# EasyEDA Pro project ProPrj_STM32H7连接板 _2026-04-26.epro, schematic Schematic1
Board Name: Board1; Create Date: 2025-03-26; Page Name: P1; Project Name: 省赛1; Schematic Name: Schematic1; Update Date: 2025-04-08; Company: 嘉立创EDA; Page Size: A4; Version: V1.0
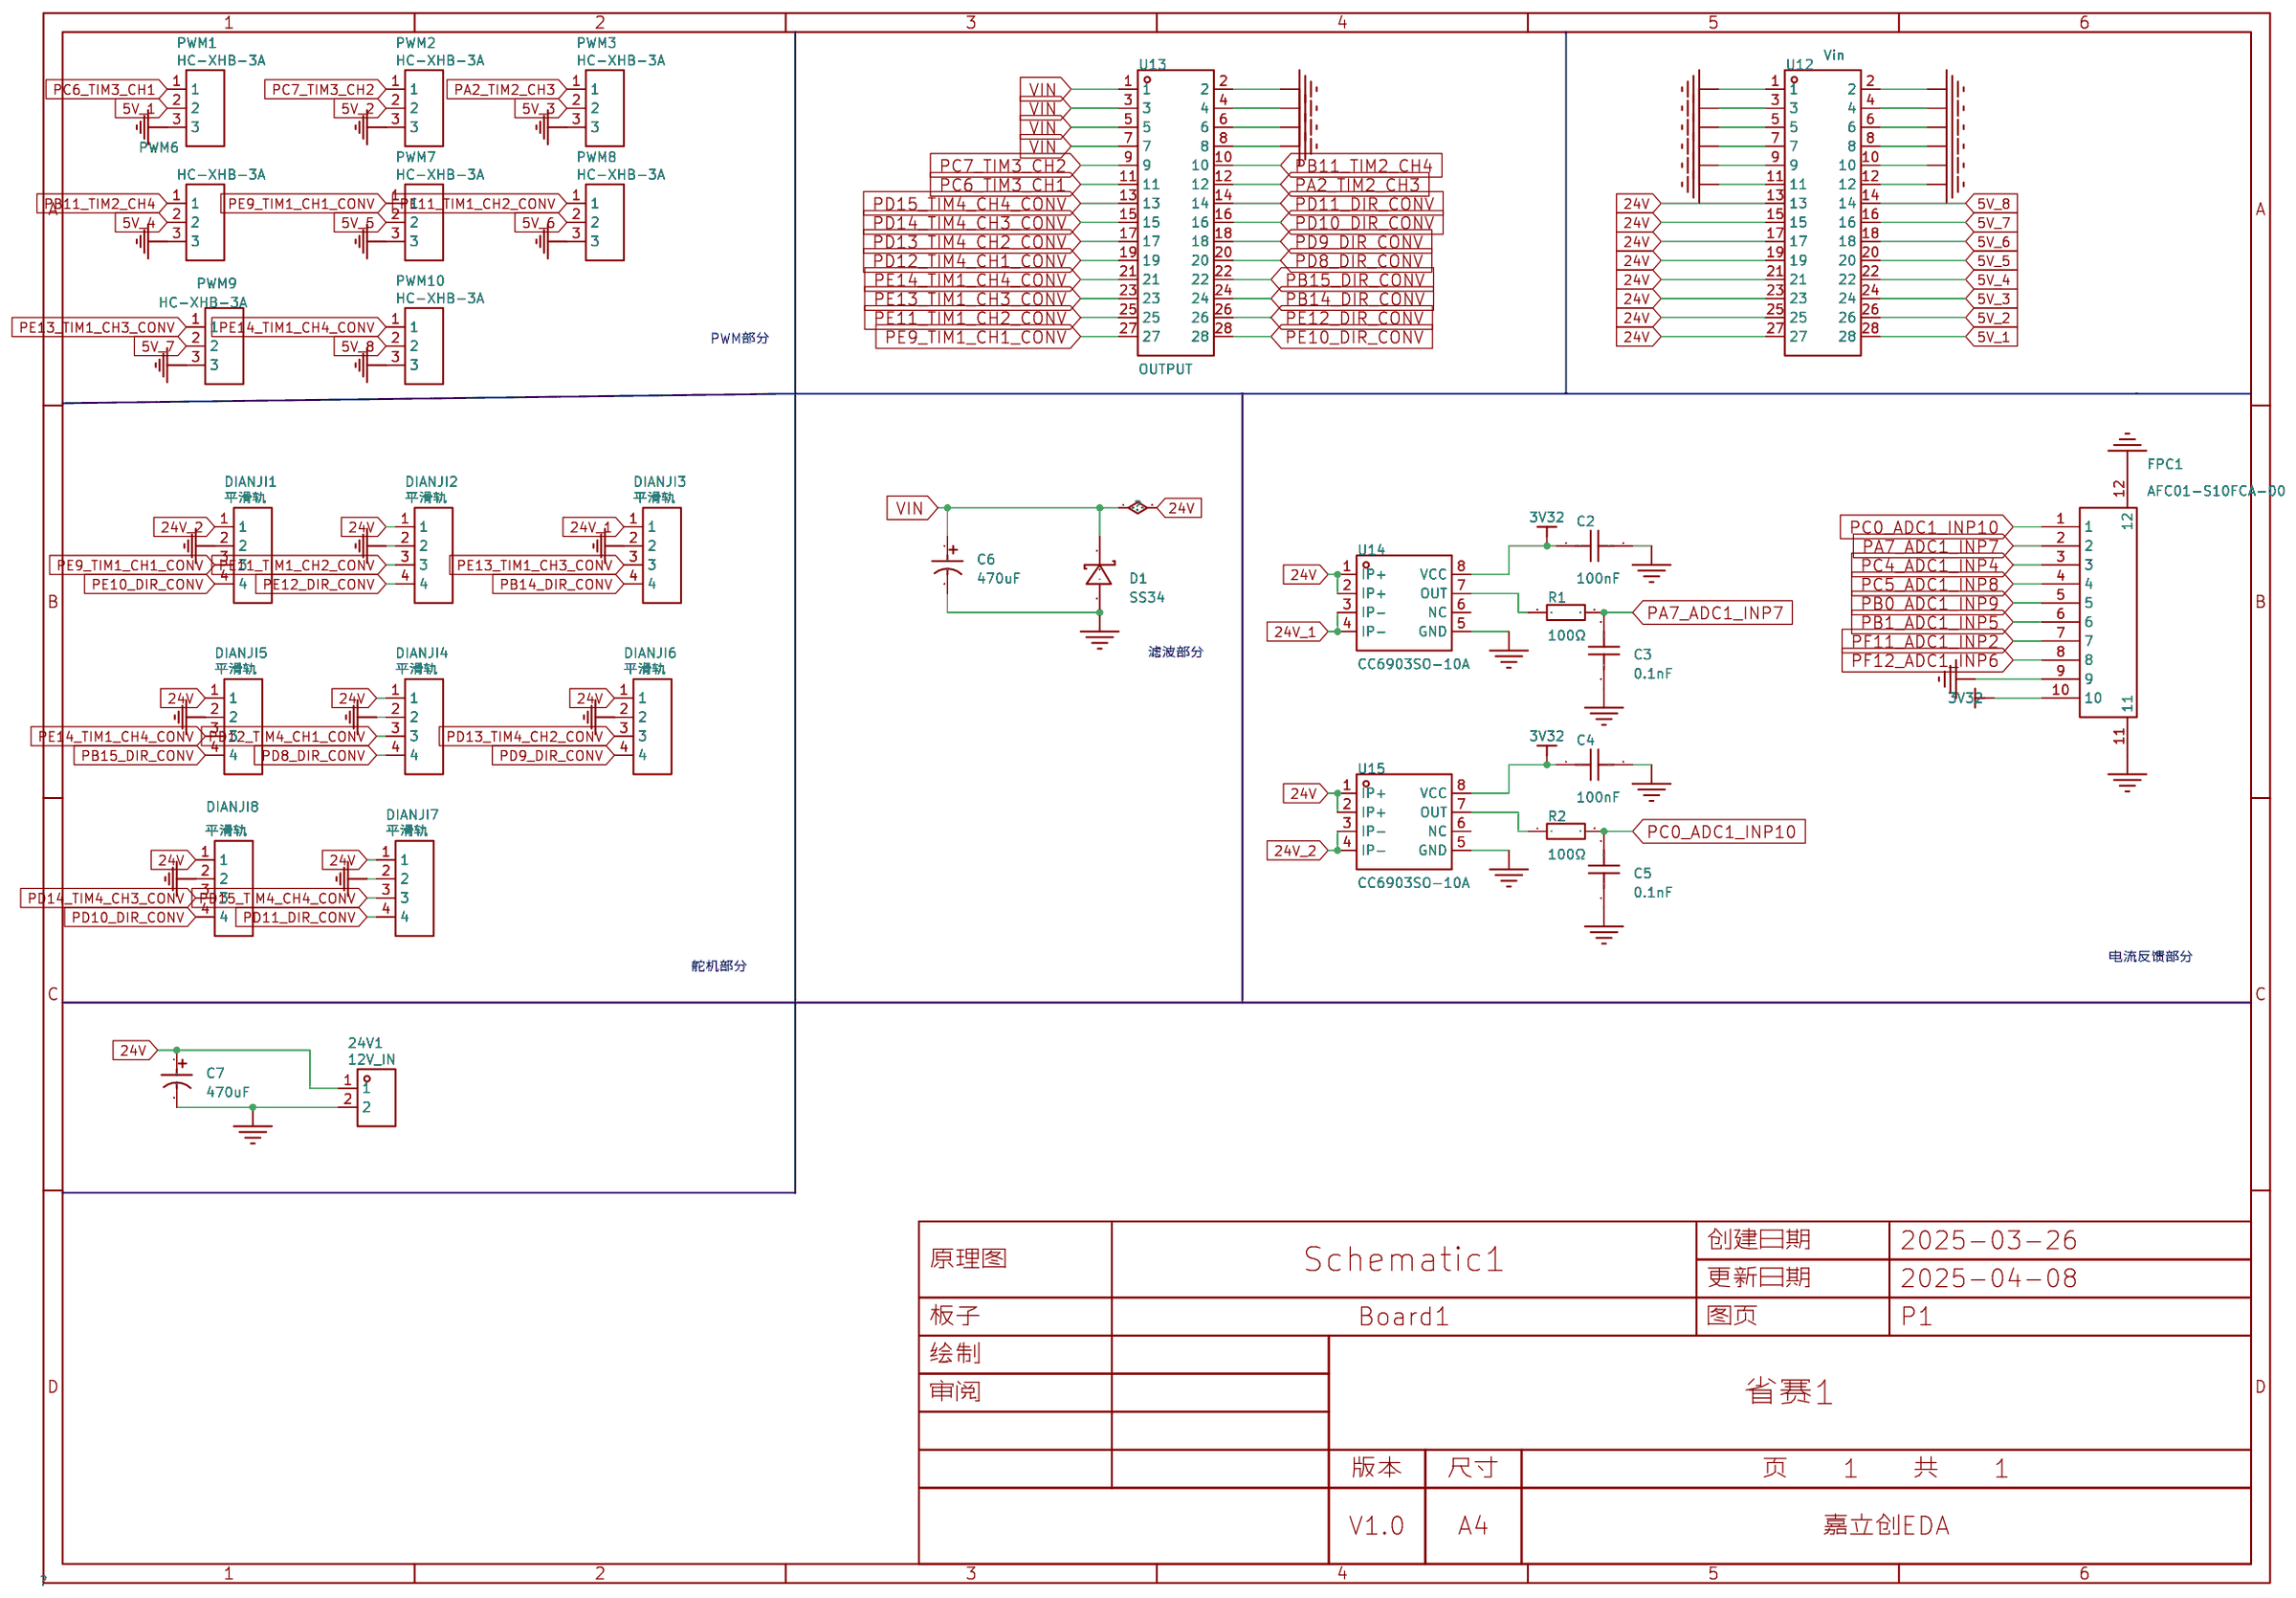
[diagram p0: schematic sheet]

## Parts
24V1  12V_IN  [CONN-TH_XY2500V-A-5.00-2P]
C2  100nF  [C0603]
C3  0.1nF  [C0603]
C4  100nF  [C0603]
C5  0.1nF  [C0603]
C6  470uF  [CAP-TH_BD10.0-P5.00-D1.0-FD]
C7  470uF  [CAP-TH_BD10.0-P5.00-D1.0-FD]
D1  SS34  [SMA_L4.3-W2.6-LS5.2-RD]
DIANJI1  平滑轨  [CONN-TH_XY2500V-A-5.00-4P]
DIANJI2  平滑轨  [CONN-TH_XY2500V-A-5.00-4P]
DIANJI3  平滑轨  [CONN-TH_XY2500V-A-5.00-4P]
DIANJI4  平滑轨  [CONN-TH_XY2500V-A-5.00-4P]
DIANJI5  平滑轨  [CONN-TH_XY2500V-A-5.00-4P]
DIANJI6  平滑轨  [CONN-TH_XY2500V-A-5.00-4P]
DIANJI7  平滑轨  [CONN-TH_XY2500V-A-5.00-4P]
DIANJI8  平滑轨  [CONN-TH_XY2500V-A-5.00-4P]
FPC1  AFC01-S10FCA-00  [FPC-SMD_P0.5-10P_FGS-XJ-H2.0]
PWM1  HC-XHB-3A  [CONN-TH_3P-P2.50_HC-XHB-3A]
PWM2  HC-XHB-3A  [CONN-TH_3P-P2.50_HC-XHB-3A]
PWM3  HC-XHB-3A  [CONN-TH_3P-P2.50_HC-XHB-3A]
PWM6  HC-XHB-3A  [CONN-TH_3P-P2.50_HC-XHB-3A]
PWM7  HC-XHB-3A  [CONN-TH_3P-P2.50_HC-XHB-3A]
PWM8  HC-XHB-3A  [CONN-TH_3P-P2.50_HC-XHB-3A]
PWM9  HC-XHB-3A  [CONN-TH_3P-P2.50_HC-XHB-3A]
PWM10  HC-XHB-3A  [CONN-TH_3P-P2.50_HC-XHB-3A]
R1  100Ω  [Res_1/8W]
R2  100Ω  [Res_1/8W]
U12  Vin  [HDR-TH_28P-P2.54-H-F-R2-C14-W8.5]
U13  OUTPUT  [HDR-TH_28P-P2.54-H-F-R2-C14-W8.5]
U14  CC6903SO-10A  [SOP-8_L4.9-W3.9-P1.27-LS6.0-BL]
U15  CC6903SO-10A  [SOP-8_L4.9-W3.9-P1.27-LS6.0-BL]

## Library data of the parts
24V1 = 12V_IN: Supplier: LCSC; Supplier Part: C505761; Manufacturer: XINLAIYA(新莱亚); Manufacturer Part: XY2500V-A-5.00-2P; JLCPCB Part Class: Extended Part
C2-C5 = CGA0603X7R104K500JT: LCSC Part Name: 100nF ±10% 50V; Supplier Part: C6119867; Manufacturer: HRE(芯声); Supplier Footprint: 0603; JLCPCB Part Class: 扩展库; Datasheet: https://atta.szlcsc.com/upload/public/pdf/source/20250103/C44077DA9E7B3EFAE02F22B6D3D1CBC9.pdf; Supplier: LCSC; Tolerance: ±10%; Voltage Rating: 50V; Temperature Coefficient: X7R
C6 C7 = ERS1HM471G20OT: LCSC Part Name: 470uF ±20% 50V; Supplier Part: C106666; Manufacturer: AISHI(艾华集团); Supplier Footprint: 插件,D10xL20mm; JLCPCB Part Class: 扩展库; Datasheet: https://atta.szlcsc.com/upload/public/pdf/source/20191015/C438940_4B8E60A742BB0AE40DDEF87A5C89089D.pdf; Supplier: LCSC; Tolerance: ±20%; Rated Voltage: 50V; Lead Spacing: 5mm; φD: 10mm; L: 20mm; Lifetime @ Temp: 7000hrs@105℃
D1 = SS34_C8678: LCSC Part Name: 电压:40V 电流:3A; Supplier Part: C8678; Manufacturer: MDD(辰达半导体); Supplier Footprint: SMA(DO-214AC); JLCPCB Part Class: 基础库; Datasheet: https://atta.szlcsc.com/upload/public/pdf/source/20240710/2118BB86FDDB2E0B294389AC1F3F65C8.pdf; Supplier: LCSC; Diode Configuration: 独立式; Forward Voltage (Vf@If): 550mV@3A; Reverse Voltage (Vr): 40V; Rectified Current: 3A; Reverse Leakage Current (Ir): 500uA@40V
DIANJI1-DIANJI8 = 平滑轨: Supplier: LCSC; Supplier Part: C505763; Manufacturer: XINLAIYA(新莱亚); Manufacturer Part: XY2500V-A-5.00-4P; JLCPCB Part Class: Extended Part
FPC1 = AFC01-S10FCA-00: LCSC Part Name: 间距:0.5mm P数:10P 翻盖式 下接; Supplier Part: C262659; Manufacturer: JS(钜硕电子); Supplier Footprint: SMD,P=0.5mm,卧贴; JLCPCB Part Class: 扩展库; Datasheet: https://atta.szlcsc.com/upload/public/pdf/source/20190816/C413942_2A72D1AC756EAE17EEDF756A339D4500.pdf; Supplier: LCSC; Locking Feature: 翻盖式; Contact Type: 下接; Number of Contacts: 10P; Pitch: 0.5mm; Mounting Type: 卧贴; FFC, FCB Thickness: 0.3mm; Height Above Board: 2mm
PWM1-PWM3 PWM6-PWM10 = HC-XHB-3A: Supplier: LCSC; Supplier Part: C2845491; Manufacturer: HCTL(华灿天禄); JLCPCB Part Class: Extended Part
R1 R2 = Res_AXIAL-1/8W: Supplier Footprint: 轴向引线
U12 U13 = PM254-2-14-W-8.5: LCSC Part Name: 2x14P 间距:2.54mm 弯插; Supplier Part: C2897434; Manufacturer: HCTL(华灿天禄); Supplier Footprint: 弯插,P=2.54mm; JLCPCB Part Class: 扩展库; Datasheet: https://atta.szlcsc.com/upload/public/pdf/source/20230609/283C0D22EF4E6FFE03D5A855876981ED.pdf; Supplier: LCSC; Holes Structure: 2x14P; Pitch: 2.54mm; Row Spacing: 2.54mm; Circular Hole / Square Hole: 方孔; Mounting Type: 弯插; Number of Rows: 双排; Number of Holes: 28P; Current Rating (Max): 3A; Holes Direction: 侧面; Insulation Height: 8.5mm; Contact Material: 铜合金; Operating Temperature Range: -40℃~+105℃; Soldering Temperature(Max): 260℃@5S
U14 U15 = CC6903SO-10A: Supplier Part: C469386; Manufacturer: CrossChip(成都芯进); Supplier Footprint: SOP-8; JLCPCB Part Class: 扩展库; Datasheet: https://atta.szlcsc.com/upload/public/pdf/source/20210401/C469386_736CACCB33E89B0F82D9E8414A64AB06.pdf; Supplier: LCSC; Current Range: -10A~10A; Supply Voltage: 3.3V; Isolated Voltage Withstand: 100Vrms; Sensitivity: 132mV/A; Standby Current: 5mA; Operating Temperature: -40℃~+125℃

## Nets
3V32: C2.1 C4.1 FPC1.10 U14.8(VCC) U15.8(VCC)
5V_1: PWM1.2 U12.28
5V_2: PWM2.2 U12.26
5V_3: PWM3.2 U12.24
5V_4: PWM6.2 U12.22
5V_5: PWM7.2 U12.20
5V_6: PWM8.2 U12.18
5V_7: PWM9.2 U12.16
5V_8: PWM10.2 U12.14
24V: 24V1.1 C6.1 C7.1 D1.1(K) DIANJI2.1 DIANJI4.1 DIANJI5.1 DIANJI6.1 DIANJI7.1 DIANJI8.1 U12.13 U12.15 U12.17 U12.19 U12.21 U12.23 U12.25 U12.27 U13.1 U13.3 U13.5 U13.7 U14.1(IP+) U14.2(IP+) U15.1(IP+) U15.2(IP+)
24V_1: DIANJI3.1 U14.3(IP-) U14.4(IP-)
24V_2: DIANJI1.1 U15.3(IP-) U15.4(IP-)
GND: 24V1.2 C2.2 C3.1 C4.2 C5.1 C6.2 C7.2 D1.2(A) DIANJI1.2 DIANJI2.2 DIANJI3.2 DIANJI4.2 DIANJI5.2 DIANJI6.2 DIANJI7.2 DIANJI8.2 FPC1.9 FPC1.11 FPC1.12 PWM1.3 PWM2.3 PWM3.3 PWM6.3 PWM7.3 PWM8.3 PWM9.3 PWM10.3 U12.1 U12.2 U12.3 U12.4 U12.5 U12.6 U12.7 U12.8 U12.9 U12.10 U12.11 U12.12 U13.2 U13.4 U13.6 U13.8 U14.5(GND) U15.5(GND)
PA2_TIM2_CH3: PWM3.1 U13.12
PA7_ADC1_INP7: C3.2 FPC1.2 R1.2
PB0_ADC1_INP9: FPC1.5
PB1_ADC1_INP5: FPC1.6
PB11_TIM2_CH4: PWM6.1 U13.10
PB14_DIR_CONV: DIANJI3.4 U13.24
PB15_DIR_CONV: DIANJI5.4 U13.22
PC0_ADC1_INP10: C5.2 FPC1.1 R2.2
PC4_ADC1_INP4: FPC1.3
PC5_ADC1_INP8: FPC1.4
PC6_TIM3_CH1: PWM1.1 U13.11
PC7_TIM3_CH2: PWM2.1 U13.9
PD8_DIR_CONV: DIANJI4.4 U13.20
PD9_DIR_CONV: DIANJI6.4 U13.18
PD10_DIR_CONV: DIANJI8.4 U13.16
PD11_DIR_CONV: DIANJI7.4 U13.14
PD12_TIM4_CH1_CONV: DIANJI4.3 U13.19
PD13_TIM4_CH2_CONV: DIANJI6.3 U13.17
PD14_TIM4_CH3_CONV: DIANJI8.3 U13.15
PD15_TIM4_CH4_CONV: DIANJI7.3 U13.13
PE9_TIM1_CH1_CONV: DIANJI1.3 PWM7.1 U13.27
PE10_DIR_CONV: DIANJI1.4 U13.28
PE11_TIM1_CH2_CONV: DIANJI2.3 PWM8.1 U13.25
PE12_DIR_CONV: DIANJI2.4 U13.26
PE13_TIM1_CH3_CONV: DIANJI3.3 PWM9.1 U13.23
PE14_TIM1_CH4_CONV: DIANJI5.3 PWM10.1 U13.21
PF11_ADC1_INP2: FPC1.7
PF12_ADC1_INP6: FPC1.8
$1N7510: R1.1 U14.7(OUT)
$1N7913: R2.1 U15.7(OUT)

Not connected (* = marked no-connect by the designer): U14 6(NC); U15 6(NC)

## Notes on the sheet
- PWM部分
- 滤波部分
- 电流反馈部分
- 舵机部分
